# Altium schematic sheet Power-Supply-Sheet.SchDoc (part 2 of 3)
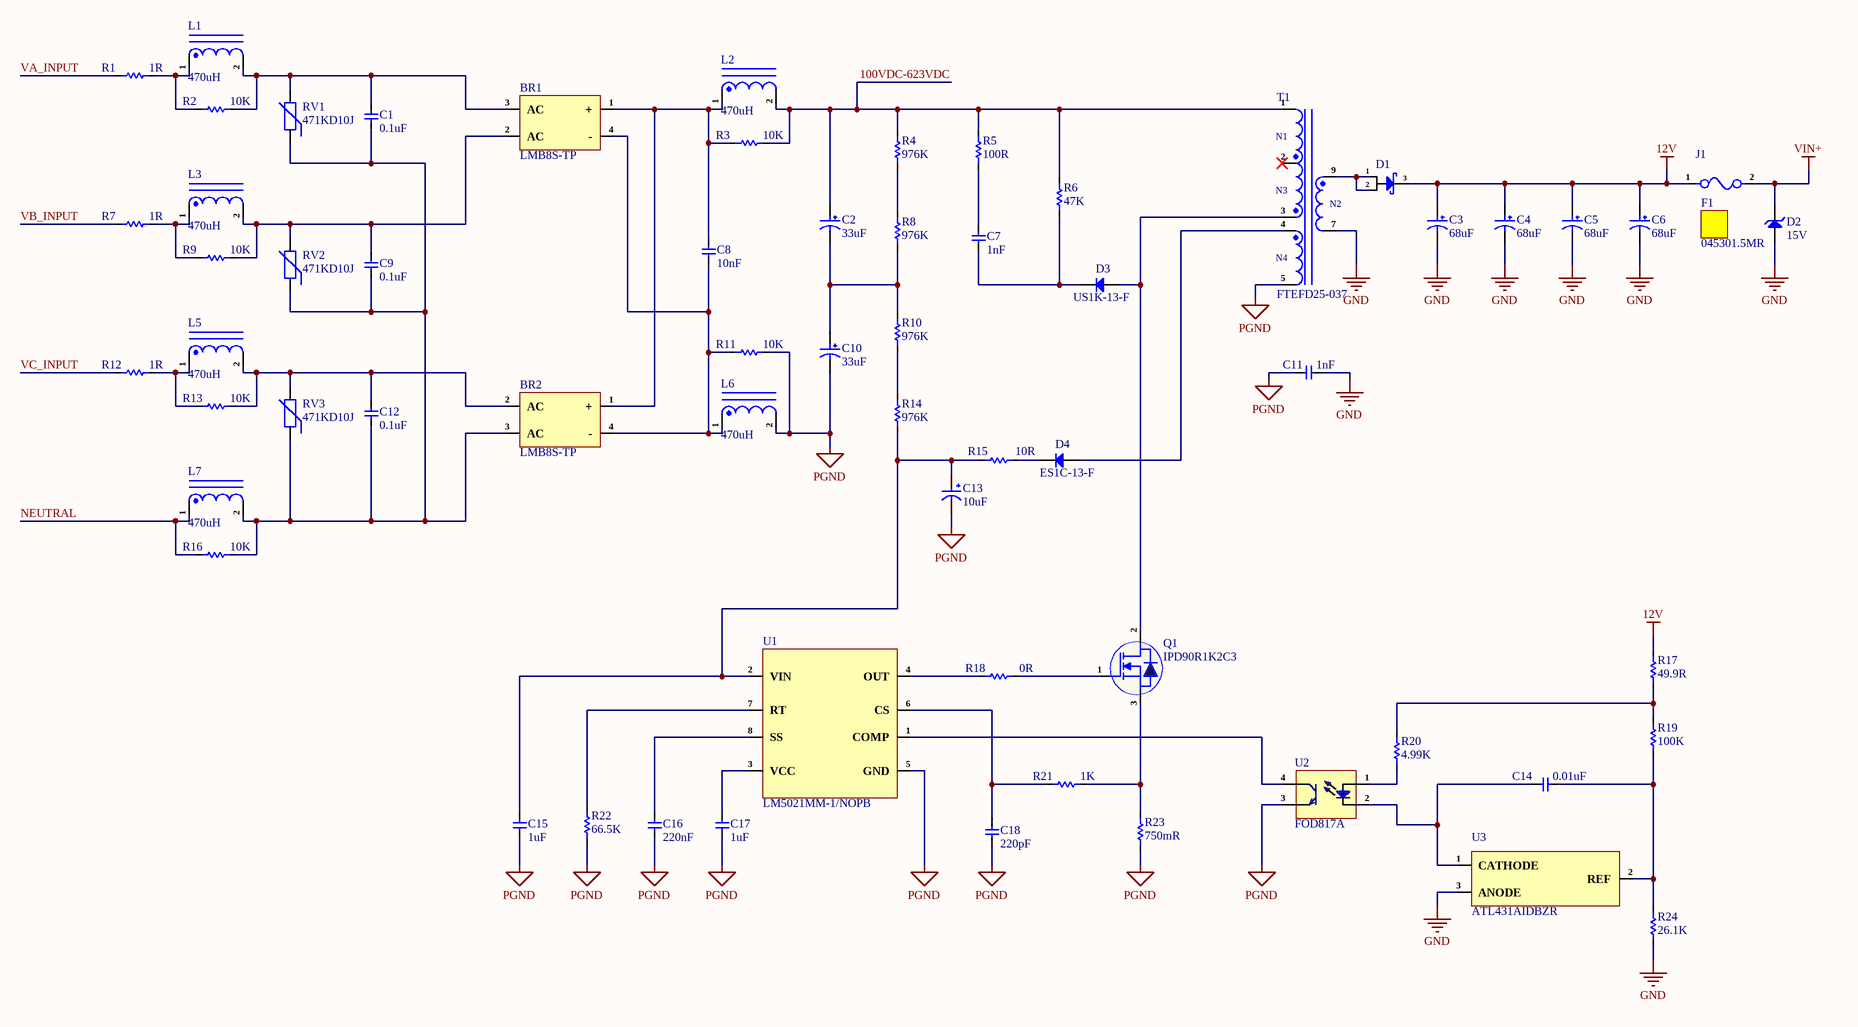
[diagram p1: Power-Supply-Sheet.SchDoc]
## Library data of the parts
BR1 BR2 = LMB8S-TP: 30A 950mV@400mA 1A 800V LMBS-1 Bridge Rectifiers ROHS; Manufacturer: MCC(Micro Commercial Components); Manufacturer Part Number: LMB8S-TP; Package: LMBS-1; LCSC Part Number: C435904; Item Type: Bridge; ComponentLink1Description: LCSC; ComponentLink1URL: https://www.lcsc.com/product-detail/Bridge-Rectifiers_MCC-Micro-Commercial-Components-LMB8S-TP_C435904.html?s_z=n_MB8S-TP
C1 C9 C12 = B32921C3104M000: CAP FILM 0.1UF 20% 630VDC RADIAL; Manufacturer: TDK EPCOS; Item Type: Film Capacitors; Dielectric Material: Polypropylene; Value: 100nF; Voltage: 630V; Dielectric: PP; Voltage Rating (AC): 305V; Insulation Resistance: 100R; Dissipation Factor: 1%; Lead Diameter: 0.6mm; Lead Length: 6mm; Ratings: X2; Supplier: Rs; LCSC Part Number: C361368; Manufacturer Part Number: B32921C3104M000; RoHS: Yes; Stock: 6670; Pricing: 100=1.997, 250=1.855, 500=1.75, 1000=1.571 (DKK); Mounting Technology: Through Hole; Case/Package: Radial; Pins: 2NUMBER; Min Operating Temperature: -40°C; Max Operating Temperature: 110°C; Tolerance: 20%; Termination: PC Pins; Series: B32921; Voltage Rating (DC): 630V; Length: 13mm; Height: 12mm; Lead Pitch: 10mm; Depth: 6mm; Reach SVHC Compliant: No; RoHS Compliant: Yes; ComponentLink1URL: https://datasheet.ciiva.com/48779/1833206-48779695.pdf?src-supplier=Element14; ComponentLink1Description: https://datasheet.ciiva.com/48779/1833206-48779695.pdf?src-supplier=Element14
C2 C10 = 87EC0494: 33uF 420V 1Ω@100kHz 430mA@100kHz ±20% Plugin,D10xL16mm Aluminum Electrolytic Capacitors - Leaded ROHS; Manufacturer: KNSCHA; Manufacturer Part Number: 87EC0494; Package: Plugin,D10xL16mm; LCSC Part Number: C6718366; Item Type: Capacitor; ComponentLink1Description: LCSC; ComponentLink1URL: https://www.lcsc.com/product-detail/Aluminum-Electrolytic-Capacitors-Leaded_KNSCHA-87EC0494_C6718366.html
C3-C6 = EEE-FK1E680P: CAP ALUM 68UF 20% 25V SMD; Manufacturer: Panasonic; Item Type: Capacitor; Material: Aluminium; Ripple Current: 240mA; Life (Hours): 2000Hour; Impedance: 360mR; Leakage Current: 3uA; Lead Diameter: 0.65mm; Supplier: Mouser; LCSC Part Number: C336242; Manufacturer Part Number: EEE-FK1E680P; RoHS: Yes; Stock: 7162; Pricing: 1=0.44, 10=0.209, 50=0.209, 100=0.15, 1000=0.12, 10000=0.1 (USD); Mounting Technology: Surface Mount,PCB; Case/Package: Radial; Pins: 2; Min Operating Temperature: -55°C; Max Operating Temperature: 105°C; Value: 68uF; Tolerance: 20%; Packaging: Tape and Reel; Termination: SMD/SMT; Series: FK; Construction: Cylindrical; Voltage Rating: 25V; Ripple Current (AC): 240mA; Voltage Rating (DC): 25V; ESR (Equivalent Series Resistance): 360mR; Package Quantity: 1000; Voltage: 25V; Diameter: 6.3mm; Length: 5.8mm; Width: 7.8mm; Height: 5.8mm; Lead Pitch: 1.8mm; Ratings: AEC-Q200; Radiation Hardening: No; Reach SVHC Compliant: No; Lead Free: Lead Free; RoHS Compliant: Yes; ComponentLink1URL: https://datasheet.ciiva.com/11777/0900766b80e4e8b0-11777398.pdf?src-supplier=Rs; ComponentLink1Description: https://datasheet.ciiva.com/11777/0900766b80e4e8b0-11777398.pdf?src-supplier=Rs; ComponentLink2URL: https://datasheet.ciiva.com/29313/443469-da-01-en-smd-elko-vfk-d-68-uf-25v-29313567.pdf?src-supplier=Conrad; ComponentLink2Description: https://datasheet.ciiva.com/29313/443469-da-01-en-smd-elko-vfk-d-68-uf-25v-29313567.pdf?src-supplier=Conrad; ComponentLink3URL: https://datasheet.ciiva.com/43458/1676921-43458431.pdf?src-supplier=Farnell; ComponentLink3Description: https://datasheet.ciiva.com/43458/1676921-43458431.pdf?src-supplier=Farnell; ComponentLink4URL: https://datasheet.ciiva.com/6059/1676921-6059990.pdf?src-supplier=Farnell; ComponentLink4Description: https://datasheet.ciiva.com/6059/1676921-6059990.pdf?src-supplier=Farnell; ComponentLink5URL: https://datasheet.ciiva.com/46376/1676921-46376456.pdf?src-supplier=Element14; ComponentLink5Description: https://datasheet.ciiva.com/46376/1676921-46376456.pdf?src-supplier=Element14; ComponentLink6URL: https://datasheet.ciiva.com/28678/731857-28678902.pdf?src-supplier=Element14; ComponentLink6Description: https://datasheet.ciiva.com/28678/731857-28678902.pdf?src-supplier=Element14; ComponentLink7URL: https://datasheet.ciiva.com/24025/aba0000ce120-24025195.pdf?src-supplier=Mouser; ComponentLink7Description: https://datasheet.ciiva.com/24025/aba0000ce120-24025195.pdf?src-supplier=Mouser; ComponentLink8URL: https://datasheet.ciiva.com/14606/70258115-14606377.pdf?src-supplier=Allied+Electronics; ComponentLink8Description: https://datasheet.ciiva.com/14606/70258115-14606377.pdf?src-supplier=Allied+Electronics; ComponentLink9URL: https://datasheet.ciiva.com/14602/70258115-14602777.pdf?src-supplier=Allied+Electronics; ComponentLink9Description: https://datasheet.ciiva.com/14602/70258115-14602777.pdf?src-supplier=Allied+Electronics; ComponentLink10URL: https://datasheet.ciiva.com/48524/fk-eng-tds-48524141.pdf?src-supplier=Distrelec; ComponentLink10Description: https://datasheet.ciiva.com/48524/fk-eng-tds-48524141.pdf?src-supplier=Distrelec; ComponentLink11URL: https://datasheet.ciiva.com/46388/1676921-46388422.pdf?src-supplier=Element14; ComponentLink11Description: https://datasheet.ciiva.com/46388/1676921-46388422.pdf?src-supplier=Element14; ComponentLink12URL: https://datasheet.ciiva.com/16201/aba0000ce120-16201529.pdf?src-supplier=Future+Electronics; ComponentLink12Description: https://datasheet.ciiva.com/16201/aba0000ce120-16201529.pdf?src-supplier=Future+Electronics; ComponentLink13URL: https://datasheet.ciiva.com/15166/getdatasheetpartid-169293-15166167.pdf?src-supplier=Verical; ComponentLink13Description: https://datasheet.ciiva.com/15166/getdatasheetpartid-169293-15166167.pdf?src-supplier=Verical; ComponentLink14URL: https://datasheet.ciiva.com/2985/aba0000ce120-2985437.pdf?src-supplier=Avnet; ComponentLink14Description: https://datasheet.ciiva.com/2985/aba0000ce120-2985437.pdf?src-supplier=Avnet; ComponentLink15URL: https://datasheet.ciiva.com/30173/aba0000ce120-30173071.pdf?src-supplier=Onlinecomponents.com; ComponentLink15Description: https://datasheet.ciiva.com/30173/aba0000ce120-30173071.pdf?src-supplier=Onlinecomponents.com
C7 = GRM31BR73A102KW01L: CAP CER 1000PF 1KV X7R 1206; Manufacturer: Murata; Item Type: Capacitors; Supplier: Mouser; LCSC Part Number: C97941; Manufacturer Part Number: GRM31BR73A102KW01L; RoHS: Yes; Stock: 17487; Pricing: 1=0.74, 10=0.361, 50=0.361, 100=0.309, 1000=0.219, 10000=0.169 (USD); Lead Free: 5697LeadFree; ComponentLink1URL: https://datasheet.ciiva.com/138/partnumbering-e-01-138541.pdf?src-supplier=Digikey; ComponentLink1Description: https://datasheet.ciiva.com/138/partnumbering-e-01-138541.pdf?src-supplier=Digikey; ComponentLink2URL: https://datasheet.ciiva.com/138/partnumbering-e-01-138542.pdf?src-supplier=Digikey; ComponentLink2Description: https://datasheet.ciiva.com/138/partnumbering-e-01-138542.pdf?src-supplier=Digikey; ComponentLink3URL: https://datasheet.ciiva.com/138/partnumbering-e-01-138543.pdf?src-supplier=Digikey; ComponentLink3Description: https://datasheet.ciiva.com/138/partnumbering-e-01-138543.pdf?src-supplier=Digikey; ComponentLink4URL: https://datasheet.ciiva.com/5421/c02e-5421641.pdf?src-supplier=Mouser; ComponentLink4Description: https://datasheet.ciiva.com/5421/c02e-5421641.pdf?src-supplier=Mouser; ComponentLink5URL: https://datasheet.ciiva.com/48512/grm31br73a102kw01l-eng-tds-48512268.pdf?src-supplier=Distrelec; ComponentLink5Description: https://datasheet.ciiva.com/48512/grm31br73a102kw01l-eng-tds-48512268.pdf?src-supplier=Distrelec
C8 = KP103J1000VP15: 10nF -40℃~+105℃ ±5% 1kV Plugin,P=15mm Polypropylene Film Capacitors (CBB) ROHS; Manufacturer: KYET; Manufacturer Part Number: KP103J1000VP15; Package: Plugin,P=15mm; LCSC Part Number: C390160; Item Type: Capacitor; ComponentLink1Description: LCSC; ComponentLink1URL: https://www.lcsc.com/product-detail/Polypropylene-Film-Capacitors-CBB_KYET-KP103J1000VP15_C390160.html
C11 = VY2102M29Y5US6TV7: CAP CER 1000PF 440VAC Y5U RADIAL; Manufacturer: Vishay BCcomponents; Item Type: Capacitors; Material: 4241ConductorMaterial; Voltage Rating: 1kV; Supplier: Mouser; LCSC Part Number: C511063; Manufacturer Part Number: VY2102M29Y5US6TV7; RoHS: Yes; Stock: 17875; Pricing: 1=0.33, 10=0.2, 50=0.2, 100=0.129, 1000=0.082, 10000=0.07 (USD); RoHS Compliant: 5897YesNo; ComponentLink1URL: https://datasheet.ciiva.com/11789/0900766b80fa7d12-11789611.pdf?src-supplier=Rs; ComponentLink1Description: https://datasheet.ciiva.com/11789/0900766b80fa7d12-11789611.pdf?src-supplier=Rs; ComponentLink2URL: https://datasheet.ciiva.com/15164/getdatasheetpartid-169624-15164808.pdf?src-supplier=Verical; ComponentLink2Description: https://datasheet.ciiva.com/15164/getdatasheetpartid-169624-15164808.pdf?src-supplier=Verical; ComponentLink3URL: https://datasheet.ciiva.com/184/vy2series-184358.pdf?src-supplier=Digikey; ComponentLink3Description: https://datasheet.ciiva.com/184/vy2series-184358.pdf?src-supplier=Digikey
C13 = TAJC106K035RNJ: CAP TANT 10UF 10% 35V 2312; Manufacturer: Kyocera AVX; Item Type: Tantalum Capacitors; Dielectric Material: Tantalum; Tolerance: 20%; ESR (Equivalent Series Resistance): 1.6R; Leakage Current: 3.5uA; Polarity: Polar; Voltage: 25V; Dissipation Factor: 6%; Life (Hours): 2000Hour; Ripple Current: 262mA; Supplier: Avnet; Supplier Part Number: TAJC106K035RNJ; Manufacturer Part Number: TAJC106K035RNJ; RoHS: Yes; Stock: 20000; Pricing: 500=0.4611, 1000=0.4505, 2000=0.4399, 3000=0.4293, 4000=0.4187, 5000=0.4081, 50000=0.4028 (USD); Mounting Technology: Surface Mount,PCB; Case/Package: Molded; Pins: 2; Case Code (Imperial): 2312; Case Code (Metric): 6032; Min Operating Temperature: -55°C; Max Operating Temperature: 125°C; Value: 10uF; Voltage Rating (DC): 35V; Voltage Rating: 35V; Features: General Purpose; Series: TAJ; Packaging: Tape and Reel; Package Quantity: 500; Termination: SMD/SMT; Construction: Flat; Length: 6mm; Width: 3.2mm; Height: 2.6mm; Depth: 3.2mm; Radiation Hardening: No; Lead Free: Lead Free; RoHS Compliant: Yes; Reach SVHC Compliant: No; ComponentLink1URL: https://datasheet.ciiva.com/11793/0900766b80ccdc61-11793205.pdf?src-supplier=Rs; ComponentLink1Description: https://datasheet.ciiva.com/11793/0900766b80ccdc61-11793205.pdf?src-supplier=Rs; ComponentLink2URL: https://datasheet.ciiva.com/26341/559442-da-01-en-tacc-c-6-0-mm-x-3-2-mm-x-2-6-mm-10-uf-26341782.pdf?src-supplier=Conrad; ComponentLink2Description: https://datasheet.ciiva.com/26341/559442-da-01-en-tacc-c-6-0-mm-x-3-2-mm-x-2-6-mm-10-uf-26341782.pdf?src-supplier=Conrad; ComponentLink3URL: https://datasheet.ciiva.com/5937/taj-5937099.pdf?src-supplier=Farnell; ComponentLink3Description: https://datasheet.ciiva.com/5937/taj-5937099.pdf?src-supplier=Farnell; ComponentLink4URL: https://datasheet.ciiva.com/7730/taj-7730983.pdf?src-supplier=Element14; ComponentLink4Description: https://datasheet.ciiva.com/7730/taj-7730983.pdf?src-supplier=Element14; ComponentLink5URL: https://datasheet.ciiva.com/7730/1703059-7730751.pdf?src-supplier=Element14; ComponentLink5Description: https://datasheet.ciiva.com/7730/1703059-7730751.pdf?src-supplier=Element14; ComponentLink6URL: https://datasheet.ciiva.com/7730/1703059-7730750.pdf?src-supplier=Element14; ComponentLink6Description: https://datasheet.ciiva.com/7730/1703059-7730750.pdf?src-supplier=Element14; ComponentLink7URL: https://datasheet.ciiva.com/7730/1680476-7730748.pdf?src-supplier=Element14; ComponentLink7Description: https://datasheet.ciiva.com/7730/1680476-7730748.pdf?src-supplier=Element14; ComponentLink8URL: https://datasheet.ciiva.com/7730/13070-7730749.pdf?src-supplier=Element14; ComponentLink8Description: https://datasheet.ciiva.com/7730/13070-7730749.pdf?src-supplier=Element14; ComponentLink9URL: https://datasheet.ciiva.com/264/taj-264350.pdf?src-supplier=Digikey; ComponentLink9Description: https://datasheet.ciiva.com/264/taj-264350.pdf?src-supplier=Digikey; ComponentLink10URL: https://datasheet.ciiva.com/264/taj-264349.pdf?src-supplier=Digikey; ComponentLink10Description: https://datasheet.ciiva.com/264/taj-264349.pdf?src-supplier=Digikey; ComponentLink11URL: https://datasheet.ciiva.com/264/taj-264351.pdf?src-supplier=Digikey; ComponentLink11Description: https://datasheet.ciiva.com/264/taj-264351.pdf?src-supplier=Digikey; ComponentLink12URL: https://datasheet.ciiva.com/12911/taj-27497-12911561.pdf?src-supplier=Mouser; ComponentLink12Description: https://datasheet.ciiva.com/12911/taj-27497-12911561.pdf?src-supplier=Mouser; ComponentLink13URL: https://datasheet.ciiva.com/14590/70001050-14590313.pdf?src-supplier=Allied+Electronics; ComponentLink13Description: https://datasheet.ciiva.com/14590/70001050-14590313.pdf?src-supplier=Allied+Electronics; ComponentLink14URL: https://datasheet.ciiva.com/3004/taj-3004476.pdf?src-supplier=Avnet; ComponentLink14Description: https://datasheet.ciiva.com/3004/taj-3004476.pdf?src-supplier=Avnet; ComponentLink15URL: https://datasheet.ciiva.com/15163/getdatasheetpartid-110753-15163367.pdf?src-supplier=Verical; ComponentLink15Description: https://datasheet.ciiva.com/15163/getdatasheetpartid-110753-15163367.pdf?src-supplier=Verical; ComponentLink16URL: https://datasheet.ciiva.com/3004/taj-3004475.pdf?src-supplier=Avnet; ComponentLink16Description: https://datasheet.ciiva.com/3004/taj-3004475.pdf?src-supplier=Avnet; LCSC Part Number: C7211
C14 = CC0603KRX7R9BB103: CAP CER 10000PF 50V X7R 0603; Manufacturer: Yageo; Material: Ceramic; Tolerance: 10%; Capacitance: 10nF; Insulation Resistance: 100GR; Supplier 1: Digi-Key; Manufacturer Part Number: CC0603KRX7R9BB103; Stock 1: 8411467; Pricing 1: 1=0.1, 10=0.038, 100=0.0171, 500=0.01224, 1000=0.00962 (USD); Mount: Surface Mount; Case/Package: 0603; Number of Pins: 2; Case Code (Metric): 1608; Case Code (Imperial): 0603; Min Operating Temperature: -55°C; Max Operating Temperature: 125°C; Dielectric: X7R; Voltage: 50V; Packaging: Tape and Reel; Voltage Rating: 50V; Voltage Rating (DC): 50V; Package Quantity: 1; Termination: SMD/SMT; Composition: Ceramic; Length: 1.6mm; Height: 0.8mm; Width: 0.031inch; Thickness: 0.035inch; Depth: 0.8mm; Radiation Hardening: No; REACH SVHC: No SVHC; Lead Free: Lead Free; Halogen Free: Halogen Free; ComponentLink1URL: http://www.farnell.com/datasheets/1734573.pdf?src-supplier=Element14; ComponentLink1Description: http://www.farnell.com/datasheets/1734573.pdf?src-supplier=Element14; ComponentLink2URL: http://www.yageo.com/documents/recent/UPY-GPHC_X7R_6.3V-to-50V_18.pdf?src-supplier=Digi-Key; ComponentLink2Description: http://www.yageo.com/documents/recent/UPY-GPHC_X7R_6.3V-to-50V_18.pdf?src-supplier=Digi-Key; ComponentLink3URL: http://www.farnell.com/datasheets/2167236.pdf?src-supplier=Mouser; ComponentLink3Description: http://www.farnell.com/datasheets/2167236.pdf?src-supplier=Mouser; ComponentLink4URL: http://www.farnell.com/datasheets/70765.pdf?src-supplier=Element14; ComponentLink4Description: http://www.farnell.com/datasheets/70765.pdf?src-supplier=Element14; ComponentLink5URL: http://www.yageo.com/documents/recent/UPY-GPHC_X7R_6.3V-to-50V_8.pdf?src-supplier=Avnet+Europe; ComponentLink5Description: http://www.yageo.com/documents/recent/UPY-GPHC_X7R_6.3V-to-50V_8.pdf?src-supplier=Avnet+Europe; ComponentLink6URL: http://www.farnell.com/datasheets/1489800.pdf?src-supplier=Element14; ComponentLink6Description: http://www.farnell.com/datasheets/1489800.pdf?src-supplier=Element14; ComponentLink7URL: https://www.verical.com/server-webapp/html/getDatasheet?partID=403582&src-supplier=Verical; ComponentLink7Description: https://www.verical.com/server-webapp/html/getDatasheet?partID=403582&src-supplier=Verical; Supplier Part Number 1: 311-1085-6-ND; LCSC Part Number: C100042
C15 C17 = CC0603KRX7R9BB105: CAP CER 1UF 50V X7R 0603; Manufacturer: Yageo; Item Type: Capacitors; Material: 4241ConductorMaterial; Tolerance: 10%; Supplier: Rs; LCSC Part Number: C559769; Manufacturer Part Number: CC0603KRX7R9BB105; RoHS: Yes; Stock: 950; Mounting Technology: Surface Mount; Case/Package: 0603; Case Code (Metric): 1608; Case Code (Imperial): 0603; Weight: 7.1E-05oz; Min Operating Temperature: -55°C; Max Operating Temperature: 125°C; Value: 1uF; Dielectric: X7R; Packaging: Tape and Reel; Voltage Rating: 50V; Termination: SMD/SMT; Voltage Rating (DC): 50V; Package Quantity: 4000; Series: CC; Length: 0.063inch; Width: 0.031inch; Height: 900um; Thickness: 0.035inch; Lead Free: Lead Free; RoHS Compliant: Yes; Halogen Free: 5694HalogenFree; ComponentLink1URL: http://www.mouser.com/ds/2/447/Yageo_UPY-GP_NP0_16V-to-50V_9-358835.pdf?src-supplier=Mouser; ComponentLink1Description: http://www.mouser.com/ds/2/447/Yageo_UPY-GP_NP0_16V-to-50V_9-358835.pdf?src-supplier=Mouser; ComponentLink2URL: http://www.yageo.com/documents/recent/UPY-GPHC_X7R_6.3V-to-50V_18.pdf?src-supplier=Digikey; ComponentLink2Description: http://www.yageo.com/documents/recent/UPY-GPHC_X7R_6.3V-to-50V_18.pdf?src-supplier=Digikey; ComponentLink3URL: https://datasheet.octopart.com/CC0603KRX7R9BB105-Yageo-datasheet-137700082.pdf?src-supplier=Future+Electronics; ComponentLink3Description: https://datasheet.octopart.com/CC0603KRX7R9BB105-Yageo-datasheet-137700082.pdf?src-supplier=Future+Electronics
C16 = CC0603KRX7R8BB224: CAP CER 0.22UF 25V X7R 0603; Manufacturer: Yageo; Item Type: Capacitors; Material: 4241ConductorMaterial; Supplier: Digikey; LCSC Part Number: C106857; Manufacturer Part Number: CC0603KRX7R8BB224; RoHS: Yes; Stock: 76385; Pricing: 1=0.13, 10=0.07, 50=0.0488, 100=0.0422, 500=0.03094, 1000=0.02743 (USD); Pins: 2NUMBER; Lead Free: 5697LeadFree; Halogen Free: 5694HalogenFree; ComponentLink1URL: http://www.mouser.com/ds/2/447/Yageo_UPY-GP_NP0_16V-to-50V_9-358835.pdf?src-supplier=Mouser; ComponentLink1Description: http://www.mouser.com/ds/2/447/Yageo_UPY-GP_NP0_16V-to-50V_9-358835.pdf?src-supplier=Mouser; ComponentLink2URL: https://datasheet.octopart.com/CC0603KRX7R8BB224-Yageo-datasheet-140260305.pdf?src-supplier=Newark; ComponentLink2Description: https://datasheet.octopart.com/CC0603KRX7R8BB224-Yageo-datasheet-140260305.pdf?src-supplier=Newark; ComponentLink3URL: https://datasheet.octopart.com/CC0603KRX7R8BB224-Yageo-datasheet-181968713.pdf?src-supplier=Element14; ComponentLink3Description: https://datasheet.octopart.com/CC0603KRX7R8BB224-Yageo-datasheet-181968713.pdf?src-supplier=Element14; ComponentLink4URL: https://datasheet.octopart.com/CC0603KRX7R8BB224-Yageo-datasheet-181968713.pdf?src-supplier=Newark; ComponentLink4Description: https://datasheet.octopart.com/CC0603KRX7R8BB224-Yageo-datasheet-181968713.pdf?src-supplier=Newark; ComponentLink5URL: https://datasheet.octopart.com/CC0603KRX7R8BB224-Yageo-datasheet-147453679.pdf?src-supplier=Farnell; ComponentLink5Description: https://datasheet.octopart.com/CC0603KRX7R8BB224-Yageo-datasheet-147453679.pdf?src-supplier=Farnell; ComponentLink6URL: https://datasheet.octopart.com/CC0603KRX7R8BB224-Yageo-datasheet-27626582.pdf?src-supplier=Future+Electronics; ComponentLink6Description: https://datasheet.octopart.com/CC0603KRX7R8BB224-Yageo-datasheet-27626582.pdf?src-supplier=Future+Electronics; ComponentLink7URL: http://www.yageo.com/documents/recent/UPY-GPHC_X7R_6.3V-to-50V_8.pdf?src-supplier=Avnet; ComponentLink7Description: http://www.yageo.com/documents/recent/UPY-GPHC_X7R_6.3V-to-50V_8.pdf?src-supplier=Avnet; ComponentLink8URL: http://www.yageo.com/documents/recent/UPY-GPHC_X7R_6.3V-to-50V_18.pdf?src-supplier=Digikey; ComponentLink8Description: http://www.yageo.com/documents/recent/UPY-GPHC_X7R_6.3V-to-50V_18.pdf?src-supplier=Digikey; ComponentLink9URL: https://datasheet.octopart.com/CC0603KRX7R8BB224-Yageo-datasheet-151948686.pdf?src-supplier=TME; ComponentLink9Description: https://datasheet.octopart.com/CC0603KRX7R8BB224-Yageo-datasheet-151948686.pdf?src-supplier=TME
C18 = CC0603JRX7R9BB221: CAP CER 220PF 50V X7R 0603; Manufacturer: Yageo; Item Type: Capacitors; Supplier: Future Electronics; LCSC Part Number: C327270; Manufacturer Part Number: CC0603JRX7R9BB221; RoHS: Yes; Stock: 12000; Pricing: 4000=0.006, 16000=0.0058, 40000=0.0057, 100000=0.0055, 160000=0.0053 (USD); ComponentLink1URL: http://www.mouser.com/ds/2/447/Yageo_UPY-GP_NP0_16V-to-50V_9-358835.pdf?src-supplier=Mouser; ComponentLink1Description: http://www.mouser.com/ds/2/447/Yageo_UPY-GP_NP0_16V-to-50V_9-358835.pdf?src-supplier=Mouser; ComponentLink2URL: http://www.yageo.com/exep/pages/download/literatures/ProductSelectionGuide%202014_Final_2.pdf?src-supplier=Digikey; ComponentLink2Description: http://www.yageo.com/exep/pages/download/literatures/ProductSelectionGuide%202014_Final_2.pdf?src-supplier=Digikey; ComponentLink3URL: https://datasheet.octopart.com/CC0603JRX7R9BB221-Yageo-datasheet-137700085.pdf?src-supplier=Future+Electronics; ComponentLink3Description: https://datasheet.octopart.com/CC0603JRX7R9BB221-Yageo-datasheet-137700085.pdf?src-supplier=Future+Electronics; ComponentLink4URL: https://www.yageo.com/upload/media/product/productsearch/datasheet/mlcc/UPY-GPHC_X7R_6.3V-to-50V_18.pdf?src-supplier=Digikey; ComponentLink4Description: https://www.yageo.com/upload/media/product/productsearch/datasheet/mlcc/UPY-GPHC_X7R_6.3V-to-50V_18.pdf?src-supplier=Digikey; ComponentLink5URL: https://datasheet.octopart.com/CC0603JRX7R9BB221-Yageo-datasheet-151948686.pdf?src-supplier=Farnell; ComponentLink5Description: https://datasheet.octopart.com/CC0603JRX7R9BB221-Yageo-datasheet-151948686.pdf?src-supplier=Farnell; ComponentLink6URL: http://www.yageo.com/documents/recent/UPY-GPHC_X7R_6.3V-to-50V_8.pdf?src-supplier=Avnet; ComponentLink6Description: http://www.yageo.com/documents/recent/UPY-GPHC_X7R_6.3V-to-50V_8.pdf?src-supplier=Avnet; ComponentLink7URL: http://www.yageo.com/documents/recent/UPY-GPHC_X7R_6.3V-to-50V_8.pdf?src-supplier=Future+Electronics; ComponentLink7Description: http://www.yageo.com/documents/recent/UPY-GPHC_X7R_6.3V-to-50V_8.pdf?src-supplier=Future+Electronics; ComponentLink8URL: https://datasheet.octopart.com/CC0603JRX7R9BB221-Yageo-datasheet-147453679.pdf?src-supplier=Newark; ComponentLink8Description: https://datasheet.octopart.com/CC0603JRX7R9BB221-Yageo-datasheet-147453679.pdf?src-supplier=Newark
D1 = FSV20150V: DIODE SCHOTTKY 150V 20A TO2773; Manufacturer: ON Semiconductor / Fairchild; Item Type: Diodes; Supplier: Arrow Electronics; LCSC Part Number: C606024; Manufacturer Part Number: FSV20150V; RoHS: Yes; Stock: 3539; Pricing: 1=1.4397, 10=1.0081, 25=0.9981, 100=0.7548, 250=0.7285, 500=0.6712, 1000=0.6139, 3000=0.5566 (USD); ComponentLink1URL: http://www.farnell.com/datasheets/2552639.pdf?src-supplier=Farnell; ComponentLink1Description: http://www.farnell.com/datasheets/2552639.pdf?src-supplier=Farnell; ComponentLink2URL: https://www.onsemi.com/pub/Collateral/FSV20150V-D.PDF?src-supplier=Digikey; ComponentLink2Description: https://www.onsemi.com/pub/Collateral/FSV20150V-D.PDF?src-supplier=Digikey; ComponentLink3URL: https://www.fairchildsemi.com/datasheets/FS/FSV20150V.pdf?src-supplier=Digikey; ComponentLink3Description: https://www.fairchildsemi.com/datasheets/FS/FSV20150V.pdf?src-supplier=Digikey; ComponentLink4URL: http://www.farnell.com/datasheets/2552639.pdf?src-supplier=Newark; ComponentLink4Description: http://www.farnell.com/datasheets/2552639.pdf?src-supplier=Newark
D2 = MMSZ5245B-7-F: DIODE ZENER 15V 500MW SOD123; Manufacturer: Diodes; Reverse Voltage: 11V; Supplier: Arrow Electronics; LCSC Part Number: C177050; Manufacturer Part Number: MMSZ5245B-7-F; RoHS: Yes; Item Type: Diodes; Stock: 414000; Pricing: 6000=0.0138 (USD); ComponentLink1URL: https://datasheet.ciiva.com/15142/getdatasheetpartid-110401-15142750.pdf?src-supplier=Verical; ComponentLink1Description: https://datasheet.ciiva.com/15142/getdatasheetpartid-110401-15142750.pdf?src-supplier=Verical; ComponentLink2URL: https://datasheet.ciiva.com/890/ds18010-890775.pdf?src-supplier=Digikey; ComponentLink2Description: https://datasheet.ciiva.com/890/ds18010-890775.pdf?src-supplier=Digikey; ComponentLink3URL: https://datasheet.ciiva.com/890/ds18010-890776.pdf?src-supplier=Digikey; ComponentLink3Description: https://datasheet.ciiva.com/890/ds18010-890776.pdf?src-supplier=Digikey; ComponentLink4URL: https://datasheet.ciiva.com/890/ds18010-890777.pdf?src-supplier=Digikey; ComponentLink4Description: https://datasheet.ciiva.com/890/ds18010-890777.pdf?src-supplier=Digikey; ComponentLink5URL: https://datasheet.ciiva.com/8025/ds18010-8025783.pdf?src-supplier=Element14; ComponentLink5Description: https://datasheet.ciiva.com/8025/ds18010-8025783.pdf?src-supplier=Element14
D3 = US1K-13-F: DIODE STANDARD 800V 1A SMA; Manufacturer: Diodes; Max Reverse Current: 5uA; Reverse Recovery Time: 75ns; Peak Non-Repetitive Surge Current: 30A; Forward Voltage: 1.7V; Supplier: Arrow Electronics; LCSC Part Number: C110532; Manufacturer Part Number: US1K-13-F; RoHS: Yes; Item Type: Diodes; Stock: 60000; Pricing: 5000=0.0427, 10000=0.0422 (USD); Mounting Technology: Surface Mount; Case/Package: SMA; Pins: 2; Weight: 0.002258oz; Min Operating Temperature: -65°C; Max Operating Temperature: 150°C; Forward Current: 1A; Max Repetitive Reverse Voltage (Vrrm): 800V; Package Quantity: 5000; Packaging: Tape and Reel; Max Surge Current: 30A; Recovery Time: 75ns; Reverse Voltage (DC): 800V; Average Rectified Current: 1A; Max Forward Surge Current (Ifsm): 30A; Termination: SMD/SMT; Voltage Rating (DC): 800V; Max Reverse Voltage (DC): 800V; Series: -; Reverse Recovery Time-Max: 75ns; Length: 4.6mm; Width: 2.92mm; Height: 2.1mm; Radiation Hardening: No; Reach SVHC Compliant: No; RoHS Compliant: Yes; ComponentLink1URL: https://datasheet.ciiva.com/8053/ds16008-8053517.pdf?src-supplier=Element14; ComponentLink1Description: https://datasheet.ciiva.com/8053/ds16008-8053517.pdf?src-supplier=Element14; ComponentLink2URL: https://datasheet.ciiva.com/22695/1906610-22695291.pdf?src-supplier=Element14; ComponentLink2Description: https://datasheet.ciiva.com/22695/1906610-22695291.pdf?src-supplier=Element14; ComponentLink3URL: https://datasheet.ciiva.com/913/ds16008-913631.pdf?src-supplier=Digikey; ComponentLink3Description: https://datasheet.ciiva.com/913/ds16008-913631.pdf?src-supplier=Digikey
D4 = ES1C-13-F: DIODE STANDARD 150V 1A SMA; Manufacturer: Diodes; Max Reverse Current: 5uA; Reverse Recovery Time: 25ns; Peak Non-Repetitive Surge Current: 30A; Forward Voltage: 920mV; Value: 10pF; Supplier: Arrow Electronics; LCSC Part Number: C781252; Manufacturer Part Number: ES1C-13-F; RoHS: Yes; Item Type: Diodes; Stock: 614; Pricing: 614=0.1548 (USD); Mounting Technology: Surface Mount; Case/Package: SMA; Pins: 2; Weight: 0.002258oz; Min Operating Temperature: -55°C; Max Operating Temperature: 150°C; Forward Current: 1A; Max Repetitive Reverse Voltage (Vrrm): 150V; Package Quantity: 5000; Packaging: Tape and Reel; Max Surge Current: 30A; Recovery Time: 25ns; Reverse Voltage (DC): 150V; Average Rectified Current: 1A; Termination: SMD/SMT; Polarity: Standard; Voltage Rating (DC): 150V; Current Rating: 1A; Output Current: 1A; Max Reverse Voltage (DC): 150V; Series: -; Reverse Recovery Time-Max: 25ns; Length: 4.6mm; Width: 2.92mm; Height: 2.1mm; Radiation Hardening: No; Lead Free: Lead Free; RoHS Compliant: Yes; ComponentLink1URL: https://datasheet.ciiva.com/914/ds14001-914688.pdf?src-supplier=Digikey; ComponentLink1Description: https://datasheet.ciiva.com/914/ds14001-914688.pdf?src-supplier=Digikey; ComponentLink2URL: https://datasheet.ciiva.com/8301/ds14001-8301646.pdf?src-supplier=Avnet; ComponentLink2Description: https://datasheet.ciiva.com/8301/ds14001-8301646.pdf?src-supplier=Avnet; ComponentLink3URL: https://datasheet.ciiva.com/914/ds14001-914689.pdf?src-supplier=Digikey; ComponentLink3Description: https://datasheet.ciiva.com/914/ds14001-914689.pdf?src-supplier=Digikey
F1 = 045301.5MR: FUSE BRD MNT 1.5A 125VAC/VDC SMD; Manufacturer: Littelfuse; Item Type: Fuses; Supplier: Digikey; LCSC Part Number: C178994; Manufacturer Part Number: 045301.5MR; RoHS: Yes; Stock: 1398; Pricing: 1=1.32, 5=1.276, 10=1.193, 50=0.9874, 100=0.8228, 250=0.80224, 500=0.67882 (USD); ComponentLink1URL: https://datasheet.ciiva.com/16378/littelfuse-fuse-451-453-16378313.pdf?src-supplier=Future+Electronics; ComponentLink1Description: https://datasheet.ciiva.com/16378/littelfuse-fuse-451-453-16378313.pdf?src-supplier=Future+Electronics; ComponentLink2URL: https://datasheet.ciiva.com/7991/littelfuse-fuse-451-453-7991903.pdf?src-supplier=Element14; ComponentLink2Description: https://datasheet.ciiva.com/7991/littelfuse-fuse-451-453-7991903.pdf?src-supplier=Element14; ComponentLink3URL: https://datasheet.ciiva.com/46406/1788341-46406156.pdf?src-supplier=Element14; ComponentLink3Description: https://datasheet.ciiva.com/46406/1788341-46406156.pdf?src-supplier=Element14; ComponentLink4URL: https://datasheet.ciiva.com/300/littelfuse-fuse-451-453-300028.pdf?src-supplier=Digikey; ComponentLink4Description: https://datasheet.ciiva.com/300/littelfuse-fuse-451-453-300028.pdf?src-supplier=Digikey; ComponentLink5URL: https://datasheet.ciiva.com/15187/getdatasheetpartid-221064-15187549.pdf?src-supplier=Verical; ComponentLink5Description: https://datasheet.ciiva.com/15187/getdatasheetpartid-221064-15187549.pdf?src-supplier=Verical; ComponentLink6URL: https://datasheet.ciiva.com/300/littelfuse-fuse-451-453-300029.pdf?src-supplier=Digikey; ComponentLink6Description: https://datasheet.ciiva.com/300/littelfuse-fuse-451-453-300029.pdf?src-supplier=Digikey; ComponentLink7URL: https://datasheet.ciiva.com/300/littelfuse-fuse-451-453-300030.pdf?src-supplier=Digikey; ComponentLink7Description: https://datasheet.ciiva.com/300/littelfuse-fuse-451-453-300030.pdf?src-supplier=Digikey; ComponentLink8URL: https://datasheet.ciiva.com/299/littelfuse-fuse-451-453-299721.pdf?src-supplier=Digikey; ComponentLink8Description: https://datasheet.ciiva.com/299/littelfuse-fuse-451-453-299721.pdf?src-supplier=Digikey; ComponentLink9URL: https://datasheet.ciiva.com/299/littelfuse-fuse-451-453-299722.pdf?src-supplier=Digikey; ComponentLink9Description: https://datasheet.ciiva.com/299/littelfuse-fuse-451-453-299722.pdf?src-supplier=Digikey; ComponentLink10URL: https://datasheet.ciiva.com/299/littelfuse-fuse-451-453-299723.pdf?src-supplier=Digikey; ComponentLink10Description: https://datasheet.ciiva.com/299/littelfuse-fuse-451-453-299723.pdf?src-supplier=Digikey
J1 = 01550900M: FUSE BLOK CARTRIDGE 125V 10A SMD; Manufacturer: Littelfuse; Item Type: Fuse Holders; Supplier: Digikey; LCSC Part Number: C108518; Manufacturer Part Number: 01550900M; RoHS: Yes; Stock: 4038; Pricing: 1=2.5, 5=2.072, 10=1.912, 50=1.586, 100=1.4631, 250=1.31448, 500=1.21164, 1000=1.11633, 5000=1.06138 (USD); Lead Free: 5697LeadFree; Reach SVHC Compliant: 4187SVHC; ComponentLink1URL: https://datasheet.ciiva.com/3812/01550900m-3812998.pdf?src-supplier=Arrow+Electronics; ComponentLink1Description: https://datasheet.ciiva.com/3812/01550900m-3812998.pdf?src-supplier=Arrow+Electronics
L1-L3 L5-L7 = PK0810-471MB: 420mA 470uH EI-core Inductor ±20% Plugin Power Inductors ROHS; Manufacturer: SXN(Shun Xiang Nuo Elec); Manufacturer Part Number: PK0810-471MB; Package: Plugin; LCSC Part Number: C400319; Item Type: Inductor; ComponentLink1Description: LCSC; ComponentLink1URL: https://www.lcsc.com/product-detail/Power-Inductors_SXN-Shun-Xiang-Nuo-Elec-PK0810-471MB_C400319.html
Q1 = IPD90R1K2C3: 900V 5.1A 83W 1.2Ω@10V,2.8A 3.5V 1 N-channel TO-252-3 MOSFETs ROHS; Manufacturer: Infineon; Item Type: Mosfet; Supplier: Mouser; LCSC Part Number: C386347; Manufacturer Part Number: IPD90R1K2C3; RoHS: Yes; Pricing: 1=1.96, 10=1.32, 50=1.32, 100=1.01, 1000=0.802, 10000=0.681 (USD); ComponentLink1URL: https://www.verical.com/server-webapp/html/getDatasheet?partID=419979&src-supplier=Verical; ComponentLink1Description: https://www.verical.com/server-webapp/html/getDatasheet?partID=419979&src-supplier=Verical; ComponentLink2URL: https://datasheet.octopart.com/IPD90R1K2C3-Infineon-datasheet-7537246.pdf?src-supplier=Farnell; ComponentLink2Description: https://datasheet.octopart.com/IPD90R1K2C3-Infineon-datasheet-7537246.pdf?src-supplier=Farnell; ComponentLink3URL: https://datasheet.octopart.com/IPD90R1K2C3ATMA1-Infineon-datasheet-32982626.pdf?src-supplier=Future+Electronics; ComponentLink3Description: https://datasheet.octopart.com/IPD90R1K2C3ATMA1-Infineon-datasheet-32982626.pdf?src-supplier=Future+Electronics
R1 R7 R12 = FMP200JR-52-1R: RES 1 OHM 5% 2W AXIAL; Manufacturer: Yageo; Item Type: Through-Hole Resistors; Supplier: Future Electronics; LCSC Part Number: C1741654; Manufacturer Part Number: FMP200JR-52-1R; RoHS: Yes; Stock: 25000; Pricing: 2500=0.0318, 7500=0.031, 12500=0.0306, 25000=0.0301, 50000=0.0293 (USD); Case/Package: Axial; Min Operating Temperature: -55°C; Max Operating Temperature: 155°C; Value: 1R; Tolerance: 5%; Packaging: Cut Tape; Number of Terminations: 2; Max Power Dissipation: 2W; Series: FMP; Package Quantity: 1; Length: 0.354inch; RoHS Compliant: Yes; Lead Free: Lead Free; ComponentLink1URL: https://datasheet.ciiva.com/2711/yageolr-fmp-2013-2711444.pdf?src-supplier=Digikey; ComponentLink1Description: https://datasheet.ciiva.com/2711/yageolr-fmp-2013-2711444.pdf?src-supplier=Digikey; ComponentLink2URL: https://datasheet.ciiva.com/2711/yageolr-fmp-2013-2711445.pdf?src-supplier=Digikey; ComponentLink2Description: https://datasheet.ciiva.com/2711/yageolr-fmp-2013-2711445.pdf?src-supplier=Digikey
R2 R3 R9 R11 R13 R16 = AC1206FR-7W10KL: RES 10K OHM 1% 1/2W 1206; Manufacturer: Yageo; Item Type: Resistors; Value: 10kR; Supplier: Mouser; LCSC Part Number: C326700; Manufacturer Part Number: AC1206FR-7W10KL; RoHS: No; Stock: 10222; Pricing: 1=0.14, 10=0.052, 50=0.052, 100=0.029, 1000=0.018, 10000=0.011 (USD); Case/Package: 340Case; Packaging: 10Packaging
R4 R8 R10 R14 = RT1206BRD07976KL: RES SMD 976K OHM 0.1% 1/4W 1206; Manufacturer: Yageo; Item Type: Resistors; Value: 976kR; Power Rating: 250mW; Voltage Rating: 200V; Temperature Coefficient: 25ppm/°C; Supplier: Digikey; LCSC Part Number: C870948; Manufacturer Part Number: RT1206BRD07976KL; RoHS: Yes; Pricing: 5000=0.0862 (USD); Case/Package: 1206; Case Code (Metric): 3216; Case Code (Imperial): 1206; Min Operating Temperature: -55°C; Max Operating Temperature: 125°C; Package Quantity: 5000; Packaging: Tape and Reel; Tolerance: 0.1%; Number of Terminations: 2; Termination: SMD/SMT; Max Power Dissipation: 250mW; Voltage Rating (DC): 200V; Series: RT; Length: 0.122inch; Width: 0.063inch; Height: 0.026inch; Lead Free: Lead Free; RoHS Compliant: Yes; ComponentLink1URL: https://datasheet.ciiva.com/2587/pyu-rt-1-to-0-05-rohs-l-5-2587907.pdf?src-supplier=Digikey; ComponentLink1Description: https://datasheet.ciiva.com/2587/pyu-rt-1-to-0-05-rohs-l-5-2587907.pdf?src-supplier=Digikey; ComponentLink2URL: https://datasheet.ciiva.com/12704/pyu-rt-1-to-0-05-rohs-l-4-12704248.pdf?src-supplier=Mouser; ComponentLink2Description: https://datasheet.ciiva.com/12704/pyu-rt-1-to-0-05-rohs-l-4-12704248.pdf?src-supplier=Mouser
R5 = AC2010FK-07100RL: RES SMD 100 OHM 1% 3/4W 2010; Manufacturer: Yageo; Item Type: Resistors; Max Power Dissipation: 750mW; Temperature Coefficient: 100ppm/°C; Supplier: Future Electronics; LCSC Part Number: C138240; Manufacturer Part Number: AC2010FK-07100RL; RoHS: Yes; Stock: 4000; Pricing: 4000=0.0203, 12000=0.0198, 20000=0.0196, 40000=0.0193, 80000=0.0188 (USD); Case/Package: 2010; Case Code (Metric): 5025; Case Code (Imperial): 2010; Min Operating Temperature: -55°C; Max Operating Temperature: 155°C; Packaging: Cut Tape; Value: 100R; Number of Terminations: 2; Tolerance: 1%; Features: Moisture Resistant,Automotive AEC-Q200; Series: AC; Ratings: AEC-Q200; RoHS Compliant: Yes; ComponentLink1URL: https://www.yageo.com/upload/media/product/productsearch/datasheet/rchip/PYu-AC_51_RoHS_L_7.pdf?src-supplier=Digikey; ComponentLink1Description: https://www.yageo.com/upload/media/product/productsearch/datasheet/rchip/PYu-AC_51_RoHS_L_7.pdf?src-supplier=Digikey
R6 = AC2512FK-0747KL: RES SMD 47K OHM 1% 1W 2512; Manufacturer: Yageo; Item Type: Resistors; Value: 47kR; Temperature Coefficient: 100ppm/°C; Voltage Rating: 200V; Supplier: Digikey; LCSC Part Number: C728203; Manufacturer Part Number: AC2512FK-0747KL; RoHS: Yes; Stock: 7724; Pricing: 1=0.59, 10=0.197, 100=0.1907, 1000=0.18462 (USD); Case/Package: 2512; Min Operating Temperature: -55°C; Max Operating Temperature: 155°C; Packaging: Tape and Reel; Number of Terminations: 2; Tolerance: 1%; Max Power Dissipation: 1W; Features: Moisture Resistant,Automotive AEC-Q200; Series: AC; Length: 0.25inch; Width: 0.122inch; Height: 0.026inch; RoHS Compliant: Yes; ComponentLink1URL: http://www.yageo.com/NewPortal/yageodocoutput?fileName=/pdf/R-Chip/PYu-AC_51_RoHS_L_5.pdf&src-supplier=Digikey; ComponentLink1Description: http://www.yageo.com/NewPortal/yageodocoutput?fileName=/pdf/R-Chip/PYu-AC_51_RoHS_L_5.pdf&src-supplier=Digikey; ComponentLink2URL: http://www.yageo.com/NewPortal/yageodocoutput?fileName=/pdf/R-Chip/PYu-AC_51_RoHS_L_6.pdf&src-supplier=Digikey; ComponentLink2Description: http://www.yageo.com/NewPortal/yageodocoutput?fileName=/pdf/R-Chip/PYu-AC_51_RoHS_L_6.pdf&src-supplier=Digikey; ComponentLink3URL: https://www.yageo.com/upload/media/product/productsearch/datasheet/rchip/PYu-AC_51_RoHS_L_7.pdf?src-supplier=Digikey; ComponentLink3Description: https://www.yageo.com/upload/media/product/productsearch/datasheet/rchip/PYu-AC_51_RoHS_L_7.pdf?src-supplier=Digikey
R15 = RC1206FR-0710RL: RES 10 OHM 1% 1/4W 1206; Manufacturer: Yageo; Item Type: Resistor; Voltage Rating (AC): 200V; Supplier: Avnet; LCSC Part Number: C108080; Manufacturer Part Number: RC1206FR-0710RL; RoHS: Yes; Stock: 3696; Pricing: 1=0.125, 25=0.043, 50=0.034, 100=0.026 (USD); Lead Free: 5697LeadFree; ComponentLink1URL: https://datasheet.ciiva.com/11819/0900766b80c6630a-11819896.pdf?src-supplier=Rs; ComponentLink1Description: https://datasheet.ciiva.com/11819/0900766b80c6630a-11819896.pdf?src-supplier=Rs; ComponentLink2URL: https://datasheet.ciiva.com/22735/444357-22735648.pdf?src-supplier=Farnell; ComponentLink2Description: https://datasheet.ciiva.com/22735/444357-22735648.pdf?src-supplier=Farnell; ComponentLink3URL: https://datasheet.ciiva.com/29181/402303-da-01-en-smd-widerstand-chip1206-10-ohm-29181572.pdf?src-supplier=Conrad; ComponentLink3Description: https://datasheet.ciiva.com/29181/402303-da-01-en-smd-widerstand-chip1206-10-ohm-29181572.pdf?src-supplier=Conrad; ComponentLink4URL: https://datasheet.ciiva.com/2460/pyu-rc1206-51-rohs-l-4-2460048.pdf?src-supplier=Digikey; ComponentLink4Description: https://datasheet.ciiva.com/2460/pyu-rc1206-51-rohs-l-4-2460048.pdf?src-supplier=Digikey; ComponentLink5URL: https://datasheet.ciiva.com/2460/pyu-rc1206-51-rohs-l-4-2460049.pdf?src-supplier=Digikey; ComponentLink5Description: https://datasheet.ciiva.com/2460/pyu-rc1206-51-rohs-l-4-2460049.pdf?src-supplier=Digikey; ComponentLink6URL: https://datasheet.ciiva.com/2460/pyu-rc1206-51-rohs-l-4-2460050.pdf?src-supplier=Digikey; ComponentLink6Description: https://datasheet.ciiva.com/2460/pyu-rc1206-51-rohs-l-4-2460050.pdf?src-supplier=Digikey; ComponentLink7URL: https://datasheet.ciiva.com/46445/444357-46445704.pdf?src-supplier=Element14; ComponentLink7Description: https://datasheet.ciiva.com/46445/444357-46445704.pdf?src-supplier=Element14; ComponentLink8URL: https://datasheet.ciiva.com/16962/pyu-rc1206-51-rohs-l-4-16962857.pdf?src-supplier=Future+Electronics; ComponentLink8Description: https://datasheet.ciiva.com/16962/pyu-rc1206-51-rohs-l-4-16962857.pdf?src-supplier=Future+Electronics
R17 = RC0603FR-0749R9L: RES 49.9 OHM 1% 1/10W 0603; Manufacturer: Yageo; Temperature Coefficient: 100ppm/°C; Voltage Rating (DC): 50V; Power Rating: 100mW; Item Type: Resistor; Supplier 1: Arrow Electronics; Manufacturer Part Number: RC0603FR-0749R9L; RoHS: Yes; Category: Chip SMD Resistors; Stock 1: 2075000; Pricing 1: 5000=0.00280 (USD); Case/Package: 0603; Number of Pins: 2; Case Code (Imperial): 0603; Case Code (Metric): 1608; Size Code: 0603; Min Operating Temperature: -55°C; Max Operating Temperature: 155°C; Tolerance: 1%; Resistance: 49.9R; Resistor Type: Thick Film; Packaging: Tape and Reel; Voltage Rating: 50V; Termination: SMD/SMT; Features: Moisture Resistant; Series: RC; Max Power Dissipation: 100mW; Number of Terminations: 2; Construction: Rectangular; Resistance Tolerance: 1%; Technology: THICK FILM; Length: 1.6mm; Height: 0.45mm; Depth: 0.8mm; Lead Free: Lead Free; REACH SVHC: No SVHC; Military Standard: Not; RoHS Compliant: Yes; ComponentLink1URL: https://datasheet.ciiva.com/11808/0900766b80f96399-11808223.pdf?src-supplier=RSComponents; ComponentLink1Description: https://datasheet.ciiva.com/11808/0900766b80f96399-11808223.pdf?src-supplier=RSComponents; ComponentLink2URL: https://datasheet.ciiva.com/22747/443971-22747527.pdf?src-supplier=Element14; ComponentLink2Description: https://datasheet.ciiva.com/22747/443971-22747527.pdf?src-supplier=Element14; ComponentLink3URL: https://datasheet.ciiva.com/15189/getdatasheetpartid-325421-15189750.pdf?src-supplier=Verical; ComponentLink3Description: https://datasheet.ciiva.com/15189/getdatasheetpartid-325421-15189750.pdf?src-supplier=Verical; Supplier Part Number 1: RC0603FR-0749R9L; LCSC Part Number: C114625
R18 = RC0805FR-070RL: RES 0 OHM JUMPER 1/8W 0805; Manufacturer: Yageo; Resistance: 0mR; Tolerance: 1%; Power Rating: 125mW; Item Type: Resistor; Supplier 1: Avnet; Manufacturer Part Number: RC0805FR-070RL; RoHS: Yes; Category: Chip SMD Resistors; Stock 1: 85000; Pricing 1: 5000=0.00281, 10000=0.00277, 20000=0.00269 (USD); Case/Package: 0805; Contact Plating: Tin,Matte; Case Code (Imperial): 0805; Case Code (Metric): 2012; Size Code: 0805; Min Operating Temperature: -55°C; Max Operating Temperature: 155°C; Resistor Type: Thick Film; Packaging: Tape and Reel; Features: Moisture Resistant; Series: RC; Max Power Dissipation: 125mW; Number of Terminations: 2; Construction: Rectangular; Length: 2mm; Depth: 1.25mm; Radiation Hardening: No; Military Standard: Not; Lead Free: Lead Free; RoHS Compliant: Yes; ComponentLink1URL: https://datasheet.ciiva.com/15189/getdatasheetpartid-348154-15189885.pdf?src-supplier=Verical; ComponentLink1Description: https://datasheet.ciiva.com/15189/getdatasheetpartid-348154-15189885.pdf?src-supplier=Verical; ComponentLink2URL: https://datasheet.ciiva.com/17042/rc0805-17042698.pdf?src-supplier=Future+Electronics; ComponentLink2Description: https://datasheet.ciiva.com/17042/rc0805-17042698.pdf?src-supplier=Future+Electronics; Supplier Part Number 1: RC0805FR-070RL; LCSC Part Number: C100045
R19 = RC0603FR-07100KL: RES 100K OHM 1% 1/10W 0603; Manufacturer: Yageo; Item Type: Resistors; Value: 100kR; Temperature Coefficient: 100ppm/°C; Voltage Rating (DC): 50V; Power Rating: 100mW; Supplier: Rs; LCSC Part Number: C14675; Manufacturer Part Number: RC0603FR-07100KL; RoHS: Yes; Stock: 27300; Case/Package: 0603; Pins: 2; Case Code (Imperial): 0603; Case Code (Metric): 1608; Min Operating Temperature: -55°C; Max Operating Temperature: 155°C; Tolerance: 1%; Resistor Type: Thick Film; Packaging: Tape and Reel; Voltage Rating: 50V; Termination: SMD/SMT; Number of Terminations: 2; Features: Moisture Resistant; Series: RC; Max Power Dissipation: 100mW; Resistance Tolerance: 1%; Construction: Rectangular; Technology: THICK FILM; Length: 1.6mm; Width: 0.8mm; Height: 0.45mm; Depth: 0.8mm; Reach SVHC Compliant: No; Lead Free: 5697LeadFree; Military Standard: Not; RoHS Compliant: Yes; Supplier Part Number: 2424020; Category: Chip SMD Resistors; Mounting Technology: Surface Mount; Weight: 7.1E-05oz; Package Quantity: 5000; ComponentLink1URL: https://datasheet.ciiva.com/11819/0900766b80f96399-11819227.pdf?src-supplier=Rs; ComponentLink1Description: https://datasheet.ciiva.com/11819/0900766b80f96399-11819227.pdf?src-supplier=Rs; ComponentLink2URL: https://datasheet.ciiva.com/2455/pyu-r-int-thick-7-2455183.pdf?src-supplier=Digikey; ComponentLink2Description: https://datasheet.ciiva.com/2455/pyu-r-int-thick-7-2455183.pdf?src-supplier=Digikey; ComponentLink3URL: https://datasheet.ciiva.com/2455/pyu-r-int-thick-7-2455184.pdf?src-supplier=Digikey; ComponentLink3Description: https://datasheet.ciiva.com/2455/pyu-r-int-thick-7-2455184.pdf?src-supplier=Digikey; ComponentLink4URL: https://datasheet.ciiva.com/2455/pyu-r-int-thick-7-2455182.pdf?src-supplier=Digikey; ComponentLink4Description: https://datasheet.ciiva.com/2455/pyu-r-int-thick-7-2455182.pdf?src-supplier=Digikey
R20 = RC0603FR-074K99L: RES 4.99K OHM 1% 1/10W 0603; Manufacturer: Yageo; Item Type: Resistors; Value: 4.99kR; Temperature Coefficient: 100ppm/°C; Voltage Rating (DC): 50V; Power Rating: 100mW; Voltage Rating: 75V; Supplier: Future Electronics; LCSC Part Number: C114621; Manufacturer Part Number: RC0603FR-074K99L; RoHS: Yes; Stock: 205000; Pricing: 5000=0.0009, 50000=0.0009, 150000=0.0008, 625000=0.0008, 1500000=0.0008 (USD); Case/Package: 0603; Pins: 2; Case Code (Imperial): 0603; Case Code (Metric): 1608; Weight: 7.1E-05oz; Min Operating Temperature: -55°C; Max Operating Temperature: 155°C; Packaging: Tape and Reel; Tolerance: 1%; Resistor Type: Thick Film; Termination: SMD/SMT; Number of Terminations: 2; Max Power Dissipation: 100mW; Features: Moisture Resistant; Series: RC; Construction: Rectangular; Resistance Tolerance: 1%; Length: 1.6mm; Width: 0.8mm; Height: 0.45mm; Depth: 0.8mm; Lead Free: Lead Free; Military Standard: Not; RoHS Compliant: Yes; Reach SVHC Compliant: Unknown
R21 = RC0603FR-071KL: RES SMD 1K OHM 1% 1/10W 0603; Manufacturer: Yageo; Resistance: 1kR; Temperature Coefficient: 100ppm/°C; Power Rating: 100mW; Voltage Rating: 50V; Item type: Resistor; ComponentLink1URL: https://www.verical.com/server-webapp/html/getDatasheet?partID=409289&src-supplier=Verical; ComponentLink1Description: https://www.verical.com/server-webapp/html/getDatasheet?partID=409289&src-supplier=Verical; Supplier 1: Digi-Key; Manufacturer Part Number: RC0603FR-071KL; Stock 1: 21472395; Pricing 1: 1=0.1, 10=0.023, 100=0.0094, 1000=0.0042, 2500=0.0037 (USD); Case/Package: 0603; Contact Plating: Tin,Matte; Case Code (Imperial): 0603; Case Code (Metric): 1608; Min Operating Temperature: -55°C; Max Operating Temperature: 155°C; Tolerance: 1%; Composition: Thick Film; Packaging: Tape and Reel; Termination: SMD/SMT; Military Standard: Not; Length: 1.6mm; Height: 0.45mm; Depth: 0.8mm; Radiation Hardening: No; REACH SVHC: No SVHC; Lead Free: Lead Free; ComponentLink2URL: http://documents.rs-components.com/techlib://itc_doclist_GB.htm?stockno=5048928&src-supplier=RSComponents; ComponentLink2Description: http://documents.rs-components.com/techlib://itc_doclist_GB.htm?stockno=5048928&src-supplier=RSComponents; ComponentLink3URL: http://www.yageo.com/documents/recent/PYu-RC0603_51_RoHS_L_4.pdf?src-supplier=Avnet+Europe; ComponentLink3Description: http://www.yageo.com/documents/recent/PYu-RC0603_51_RoHS_L_4.pdf?src-supplier=Avnet+Europe; ComponentLink4URL: http://www.farnell.com/datasheets/2167052.pdf?src-supplier=Element14; ComponentLink4Description: http://www.farnell.com/datasheets/2167052.pdf?src-supplier=Element14; ComponentLink5URL: http://www.farnell.com/datasheets/1868787.pdf?src-supplier=Element14; ComponentLink5Description: http://www.farnell.com/datasheets/1868787.pdf?src-supplier=Element14; ComponentLink6URL: http://www.yageo.com/documents/recent/PYu-RC_Group_51_RoHS_L_2.pdf?src-supplier=Avnet; ComponentLink6Description: http://www.yageo.com/documents/recent/PYu-RC_Group_51_RoHS_L_2.pdf?src-supplier=Avnet; ComponentLink7URL: https://www.verical.com/server-webapp/html/getDatasheet?partID=404327&src-supplier=Verical; ComponentLink7Description: https://www.verical.com/server-webapp/html/getDatasheet?partID=404327&src-supplier=Verical; ComponentLink8URL: http://www.farnell.com/datasheets/443971.pdf?src-supplier=Element14; ComponentLink8Description: http://www.farnell.com/datasheets/443971.pdf?src-supplier=Element14; Supplier Part Number 1: 311-1.00KHRDKR-ND; LCSC Part Number: C22548
R22 = RT0603BRD0766K5L: RES SMD 66.5KOHM 0.1% 1/10W 0603; Manufacturer: Yageo; Item Type: Resistors; Voltage Rating (DC): 50V; Supplier: Digikey; LCSC Part Number: C861515; Manufacturer Part Number: RT0603BRD0766K5L; RoHS: Yes; Stock: 16544; Pricing: 1=0.14, 10=0.102, 50=0.0846, 100=0.0755, 500=0.05814, 1000=0.04896 (USD); Lead Free: 5697LeadFree; ComponentLink1URL: https://datasheet.ciiva.com/12809/pyu-rt-1-to-0-05-rohs-l-4-12809883.pdf?src-supplier=Mouser; ComponentLink1Description: https://datasheet.ciiva.com/12809/pyu-rt-1-to-0-05-rohs-l-4-12809883.pdf?src-supplier=Mouser
R23 = RL1206FR-7W0R75L: RES 0.75 OHM 1% 1/2W 1206; Manufacturer: Yageo; Item Type: Resistors; Supplier: Digikey; LCSC Part Number: C859938; Manufacturer Part Number: RL1206FR-7W0R75L; RoHS: Yes; Stock: 5438; Pricing: 1=0.36, 10=0.095, 100=0.0857, 1000=0.0765, 2500=0.07497 (USD); ComponentLink1URL: http://www.mouser.com/ds/2/447/PYu-RL_Group_521_RoHS_L_2-1131815.pdf?src-supplier=Mouser; ComponentLink1Description: http://www.mouser.com/ds/2/447/PYu-RL_Group_521_RoHS_L_2-1131815.pdf?src-supplier=Mouser; ComponentLink2URL: https://www.yageo.com/upload/media/product/productsearch/datasheet/rchip/PYu-RL_Group_521_RoHS_L_2.pdf?src-supplier=Digikey; ComponentLink2Description: https://www.yageo.com/upload/media/product/productsearch/datasheet/rchip/PYu-RL_Group_521_RoHS_L_2.pdf?src-supplier=Digikey; ComponentLink3URL: http://www.yageo.com/exep/pages/download/literatures/R-chip_current%20sensor_20140512.pdf?src-supplier=Digikey; ComponentLink3Description: http://www.yageo.com/exep/pages/download/literatures/R-chip_current%20sensor_20140512.pdf?src-supplier=Digikey; ComponentLink4URL: https://datasheet.octopart.com/RL1206FR-7W0R75L-Yageo-datasheet-83209227.pdf?src-supplier=Future+Electronics; ComponentLink4Description: https://datasheet.octopart.com/RL1206FR-7W0R75L-Yageo-datasheet-83209227.pdf?src-supplier=Future+Electronics